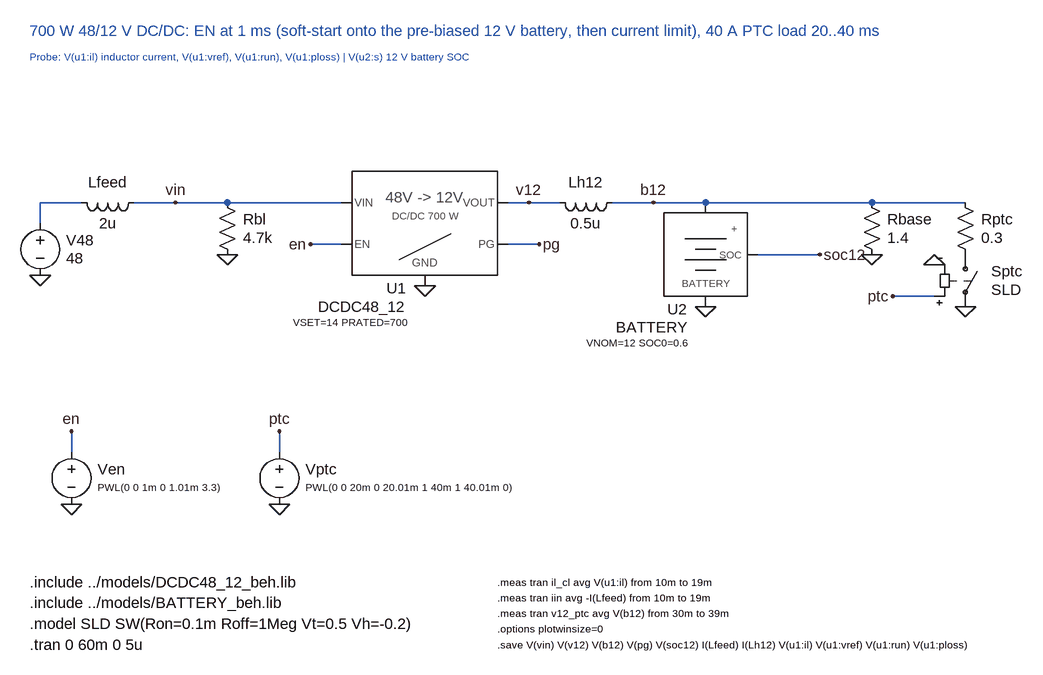
[diagram p0: schematic demo_dcdc.asc]
demo_dcdc.asc, the LTspice schematic file:
Version 4
SHEET 1 1700 1000
SYMBOL voltage 48 240 R0
WINDOW 0 40 42 Left 2
WINDOW 3 40 70 Left 2
SYMATTR InstName V48
SYMATTR Value 48
FLAG 48 336 0
SYMBOL ind 208 208 R90
WINDOW 0 0 56 VBottom 2
WINDOW 3 32 56 VTop 2
SYMATTR InstName Lfeed
SYMATTR Value 2u
SYMATTR SpiceLine Rser=10m
WIRE 48 256 48 224
WIRE 48 224 112 224
SYMBOL res 320 208 R0
WINDOW 0 40 42 Left 2
WINDOW 3 40 70 Left 2
SYMATTR InstName Rbl
SYMATTR Value 4.7k
FLAG 336 304 0
WIRE 192 224 256 224
WIRE 256 224 336 224
FLAG 256 224 vin
SYMBOL DCDC48_12 640 256 R0
SYMATTR InstName U1
SYMATTR SpiceLine VSET=14 PRATED=700
WIRE 336 224 512 224
FLAG 640 352 0
WIRE 512 288 464 288
FLAG 464 288 en
WIRE 768 288 816 288
FLAG 816 288 pg
SYMBOL ind 944 208 R90
WINDOW 0 0 56 VBottom 2
WINDOW 3 32 56 VTop 2
SYMATTR InstName Lh12
SYMATTR Value 0.5u
SYMATTR SpiceLine Rser=2m
WIRE 768 224 800 224
WIRE 800 224 848 224
FLAG 800 224 v12
SYMBOL BATTERY 1072 304 R0
SYMATTR InstName U2
SYMATTR SpiceLine VNOM=12 SOC0=0.6
WIRE 928 224 992 224
WIRE 992 224 1072 224
FLAG 992 224 b12
FLAG 1072 384 0
WIRE 1152 304 1248 304
FLAG 1248 304 soc12
SYMBOL res 1312 208 R0
WINDOW 0 40 42 Left 2
WINDOW 3 40 70 Left 2
SYMATTR InstName Rbase
SYMATTR Value 1.4
WIRE 1072 224 1328 224
FLAG 1328 304 0
SYMBOL res 1456 208 R0
WINDOW 0 40 42 Left 2
WINDOW 3 40 70 Left 2
SYMATTR InstName Rptc
SYMATTR Value 0.3
WIRE 1328 224 1472 224
SYMBOL sw 1472 288 R0
WINDOW 0 40 42 Left 2
WINDOW 3 40 70 Left 2
SYMATTR InstName Sptc
SYMATTR Value SLD
FLAG 1472 384 0
WIRE 1424 368 1360 368
FLAG 1360 368 ptc
FLAG 1424 320 0
SYMBOL voltage 96 592 R0
WINDOW 0 40 42 Left 2
WINDOW 3 40 70 Left 1
SYMATTR InstName Ven
SYMATTR Value PWL(0 0 1m 0 1.01m 3.3)
WIRE 96 608 96 576
FLAG 96 576 en
FLAG 96 688 0
SYMBOL voltage 416 592 R0
WINDOW 0 40 42 Left 2
WINDOW 3 40 70 Left 1
SYMATTR InstName Vptc
SYMATTR Value PWL(0 0 20m 0 20.01m 1 40m 1 40.01m 0)
WIRE 416 608 416 576
FLAG 416 576 ptc
FLAG 416 688 0
TEXT 32 -40 Left 2 ;700 W 48/12 V DC/DC: EN at 1 ms (soft-start onto the pre-biased 12 V battery, then current limit), 40 A PTC load 20..40 ms
TEXT 32 0 Left 1 ;Probe: V(u1:il) inductor current, V(u1:vref), V(u1:run), V(u1:ploss) | V(u2:s) 12 V battery SOC
TEXT 32 808 Left 2 !.include ../models/DCDC48_12_beh.lib
TEXT 32 840 Left 2 !.include ../models/BATTERY_beh.lib
TEXT 32 872 Left 2 !.model SLD SW(Ron=0.1m Roff=1Meg Vt=0.5 Vh=-0.2)
TEXT 32 904 Left 2 !.tran 0 60m 0 5u
TEXT 752 808 Left 1 !.meas tran il_cl avg V(u1:il) from 10m to 19m
TEXT 752 832 Left 1 !.meas tran iin avg -I(Lfeed) from 10m to 19m
TEXT 752 856 Left 1 !.meas tran v12_ptc avg V(b12) from 30m to 39m
TEXT 752 880 Left 1 !.options plotwinsize=0
TEXT 752 904 Left 1 !.save V(vin) V(v12) V(b12) V(pg) V(soc12) I(Lfeed) I(Lh12) V(u1:il) V(u1:vref) V(u1:run) V(u1:ploss)

The netlist it stands for:
* demo_dcdc.asc
V48 N001 0 48
Lfeed vin N001 2u Rser=10m
Rbl vin 0 4.7k
XU1 vin v12 0 en pg DCDC48_12 VSET=14 PRATED=700  ; pins VIN VOUT GND EN PG
Lh12 b12 v12 0.5u Rser=2m
XU2 b12 0 soc12 BATTERY VNOM=12 SOC0=0.6  ; pins P N SOC
Rbase b12 0 1.4
Rptc b12 P001 0.3
Sptc P001 0 ptc 0 SLD
Ven en 0 PWL(0 0 1m 0 1.01m 3.3)
Vptc ptc 0 PWL(0 0 20m 0 20.01m 1 40m 1 40.01m 0)
* 700 W 48/12 V DC/DC: EN at 1 ms (soft-start onto the pre-biased 12 V battery, then current limit), 40 A PTC load 20..40 ms
* Probe: V(u1:il) inductor current, V(u1:vref), V(u1:run), V(u1:ploss) | V(u2:s) 12 V battery SOC
.include ../models/DCDC48_12_beh.lib
.include ../models/BATTERY_beh.lib
.model SLD SW(Ron=0.1m Roff=1Meg Vt=0.5 Vh=-0.2)
.tran 0 60m 0 5u
.meas tran il_cl avg V(u1:il) from 10m to 19m
.meas tran iin avg -I(Lfeed) from 10m to 19m
.meas tran v12_ptc avg V(b12) from 30m to 39m
.options plotwinsize=0
.save V(vin) V(v12) V(b12) V(pg) V(soc12) I(Lfeed) I(Lh12) V(u1:il) V(u1:vref) V(u1:run) V(u1:ploss)
.backanno
.end